# EasyEDA Pro project srm_不晦启明_B.eprj, schematic remote

## Sheets
1 MCU: Board Name: Board2; Create Date: 2026-10-03; Page Name: MCU; Project Name: 不晦启明_srm; Schematic Name: remote; Update Date: 2026-10-06; Company: 嘉立创EDA; Page Size: A4; Version: V1.0
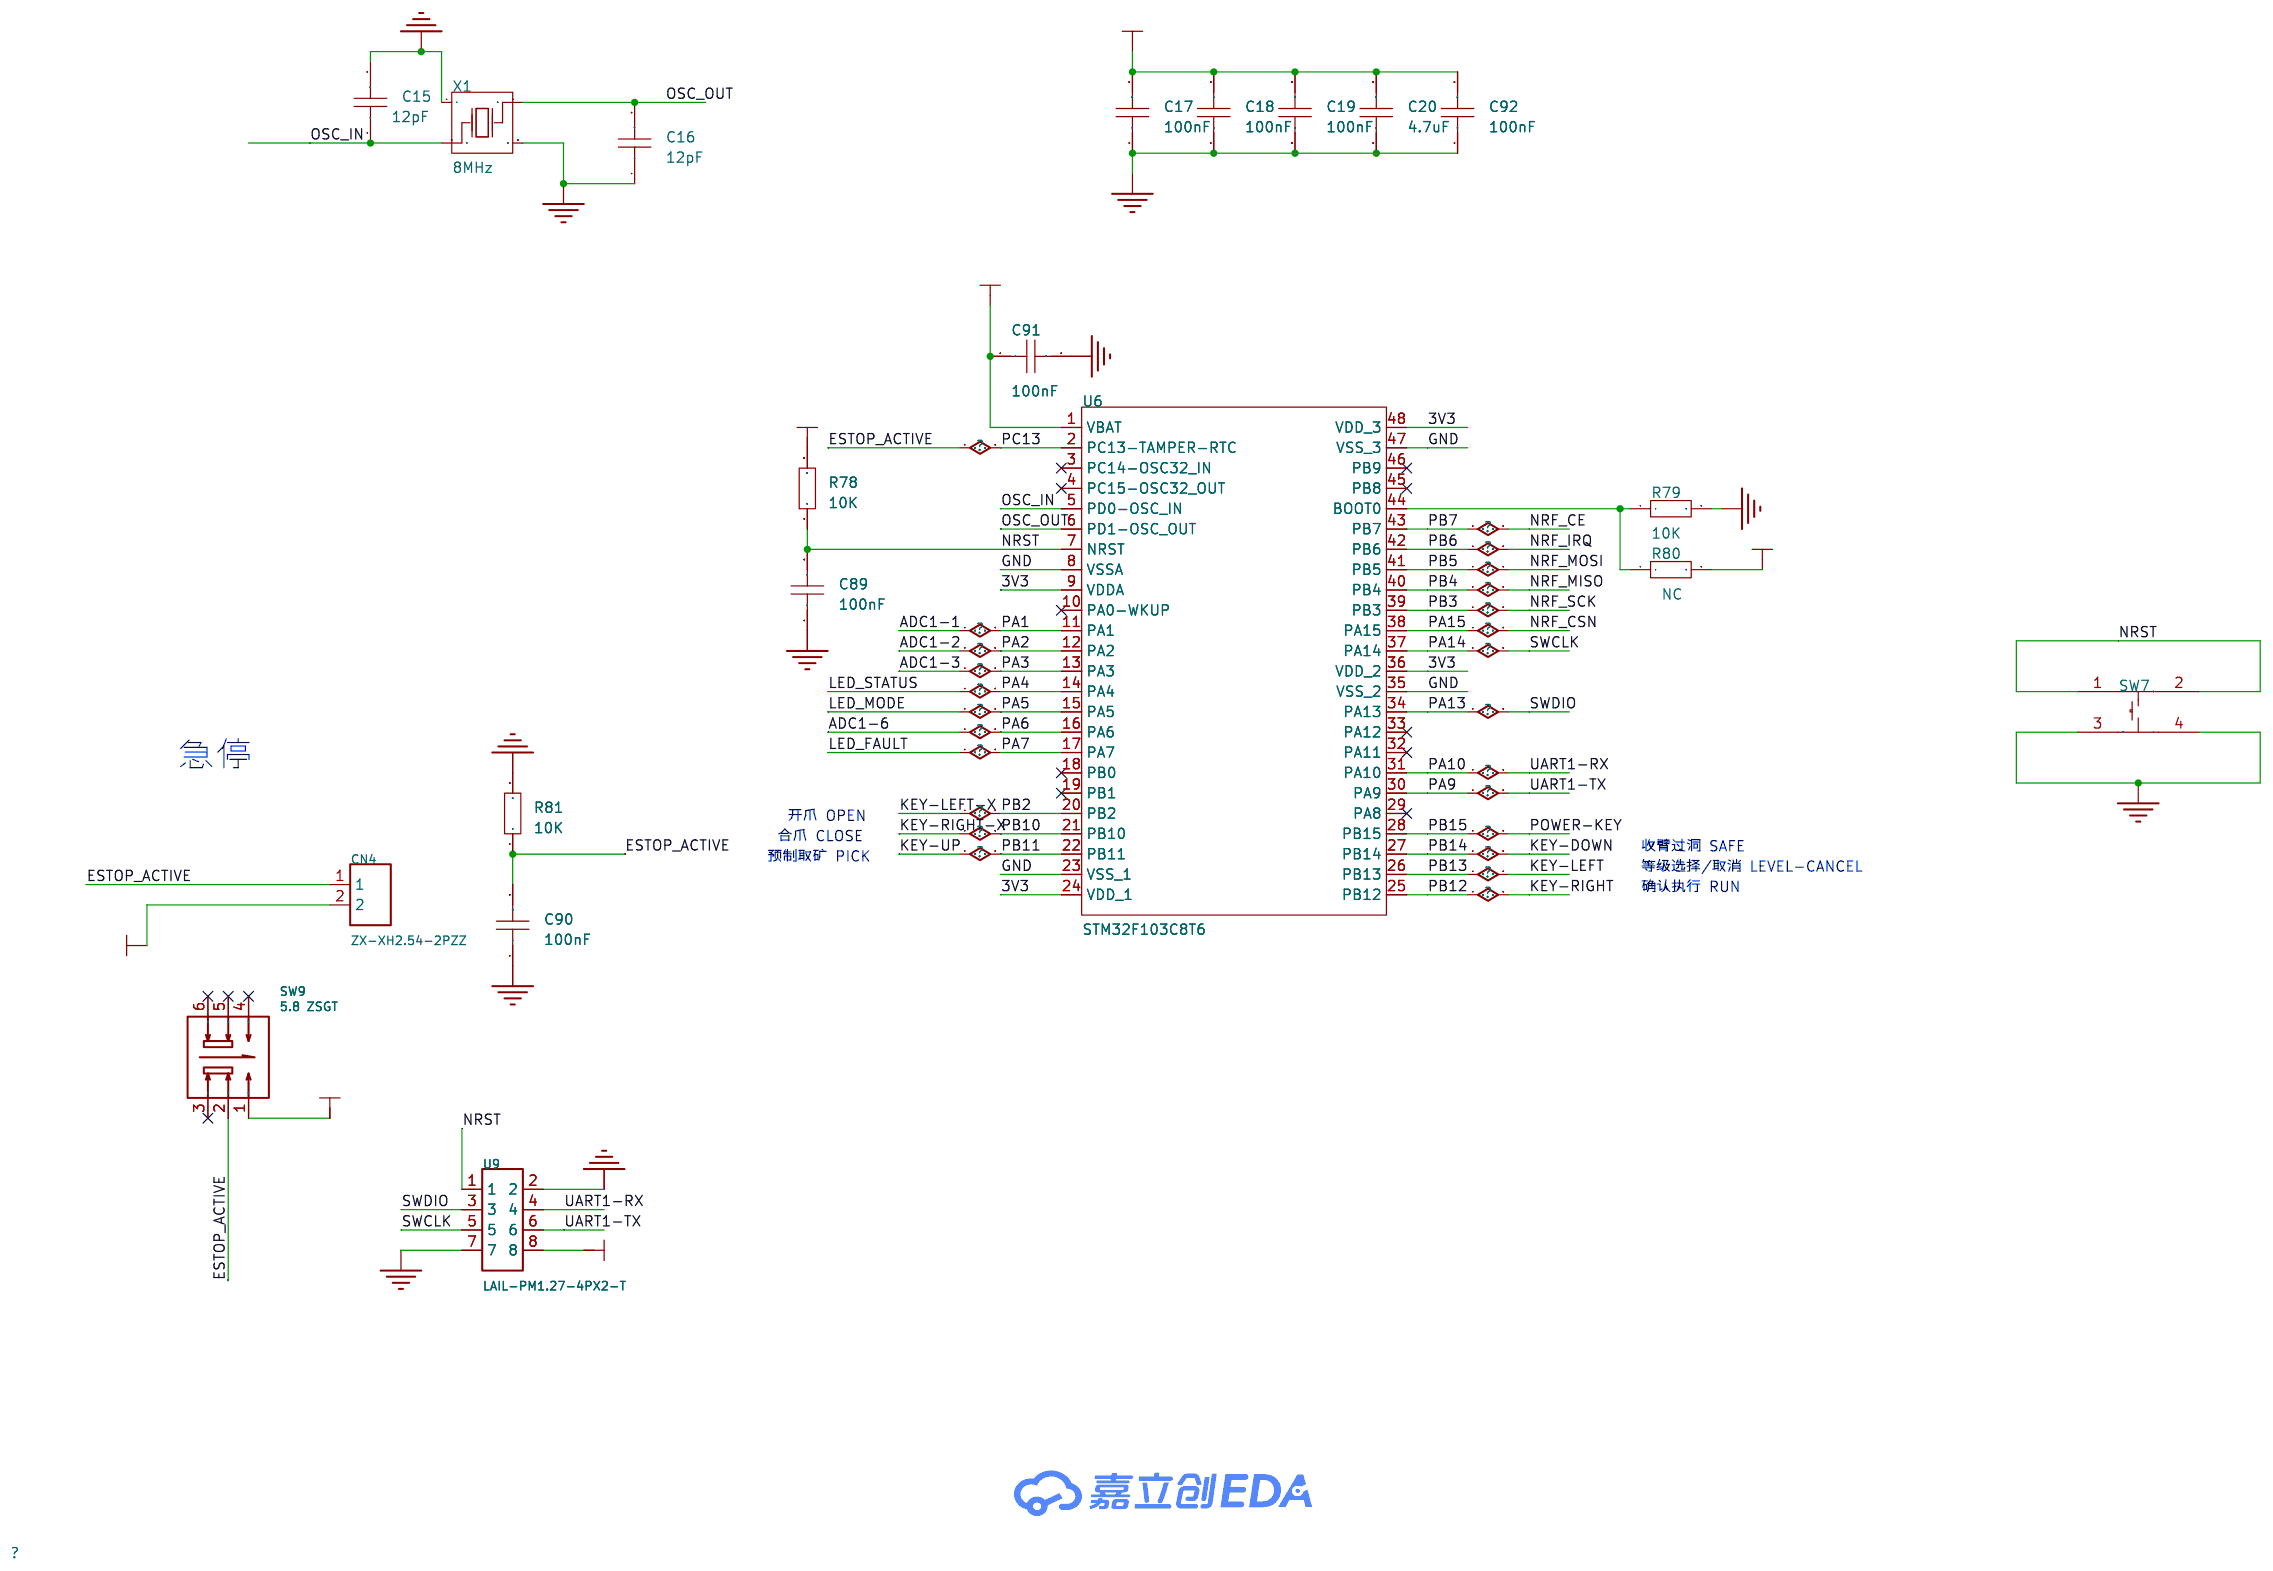
[diagram p8: MCU]
2 无线: Create Date: 2026-10-05; Page Name: 无线; Update Date: 2026-10-05
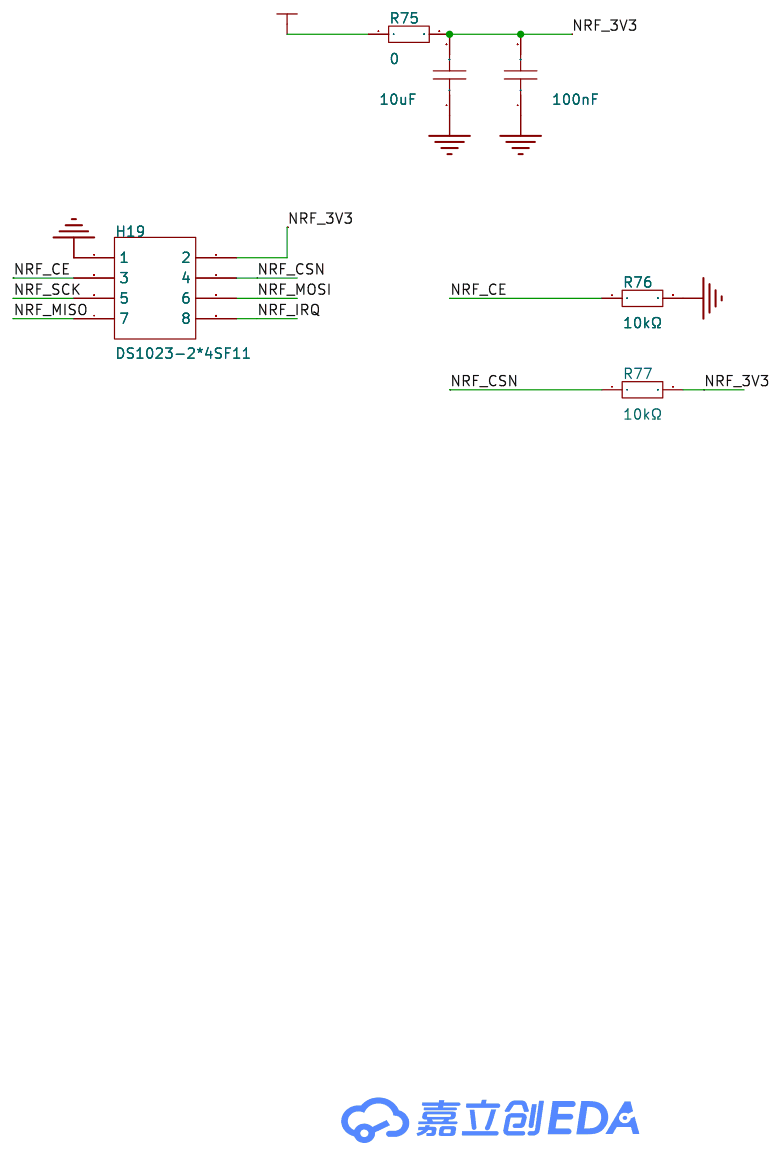
[diagram p9: 无线]
3 遥感和按键: Create Date: 2026-10-05; Page Name: 遥感和按键; Update Date: 2026-10-05
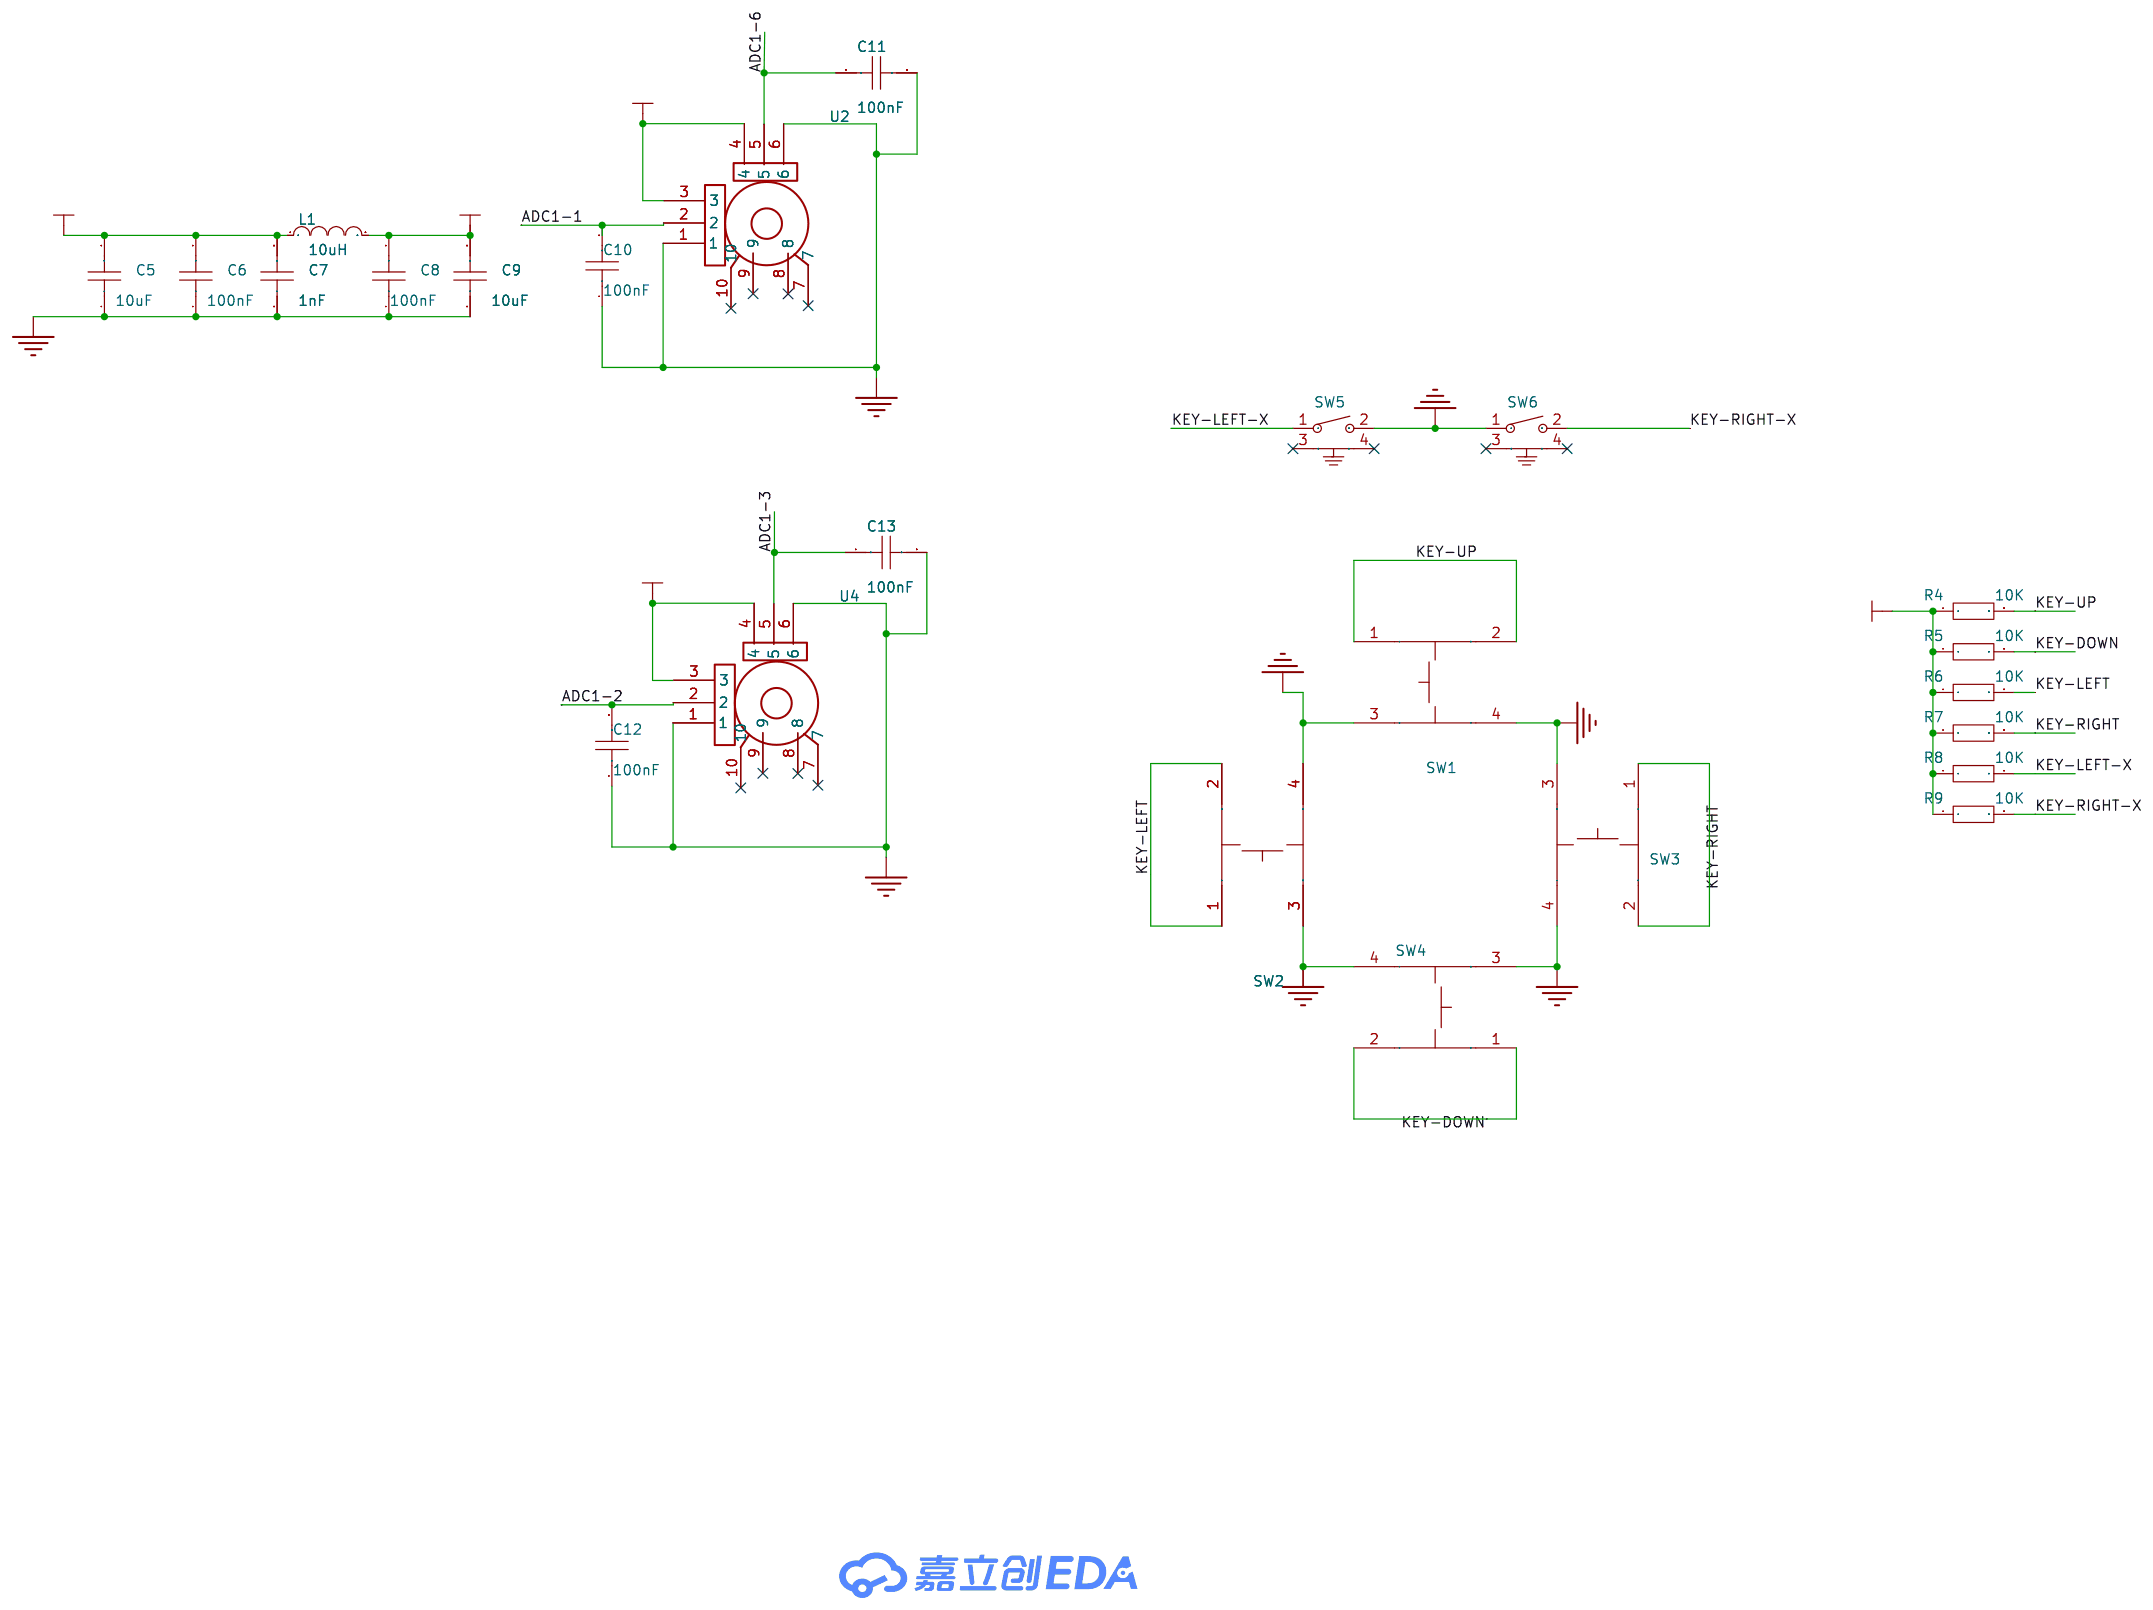
[diagram p10: 遥感和按键]
4 指示灯: Create Date: 2026-10-05; Page Name: 指示灯; Update Date: 2026-10-05
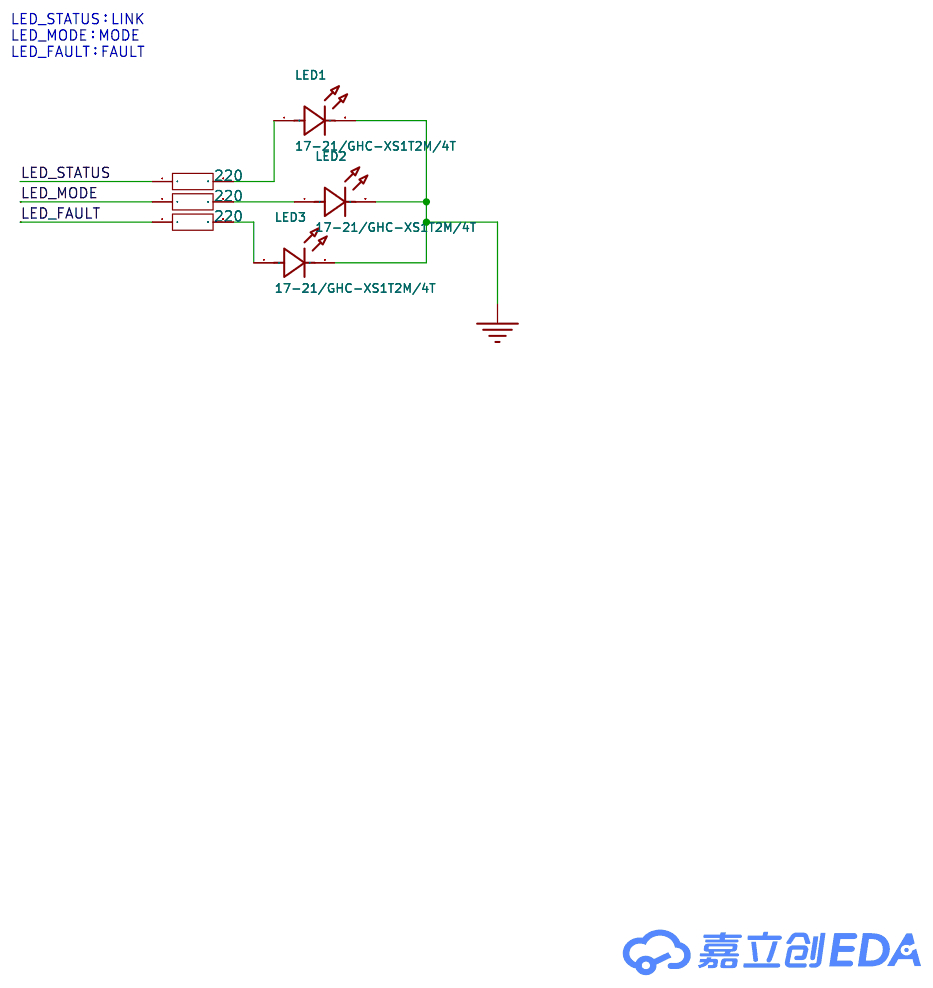
[diagram p11: 指示灯]
5 电源管理: Create Date: 2026-10-05; Page Name: 电源管理; Update Date: 2026-10-05
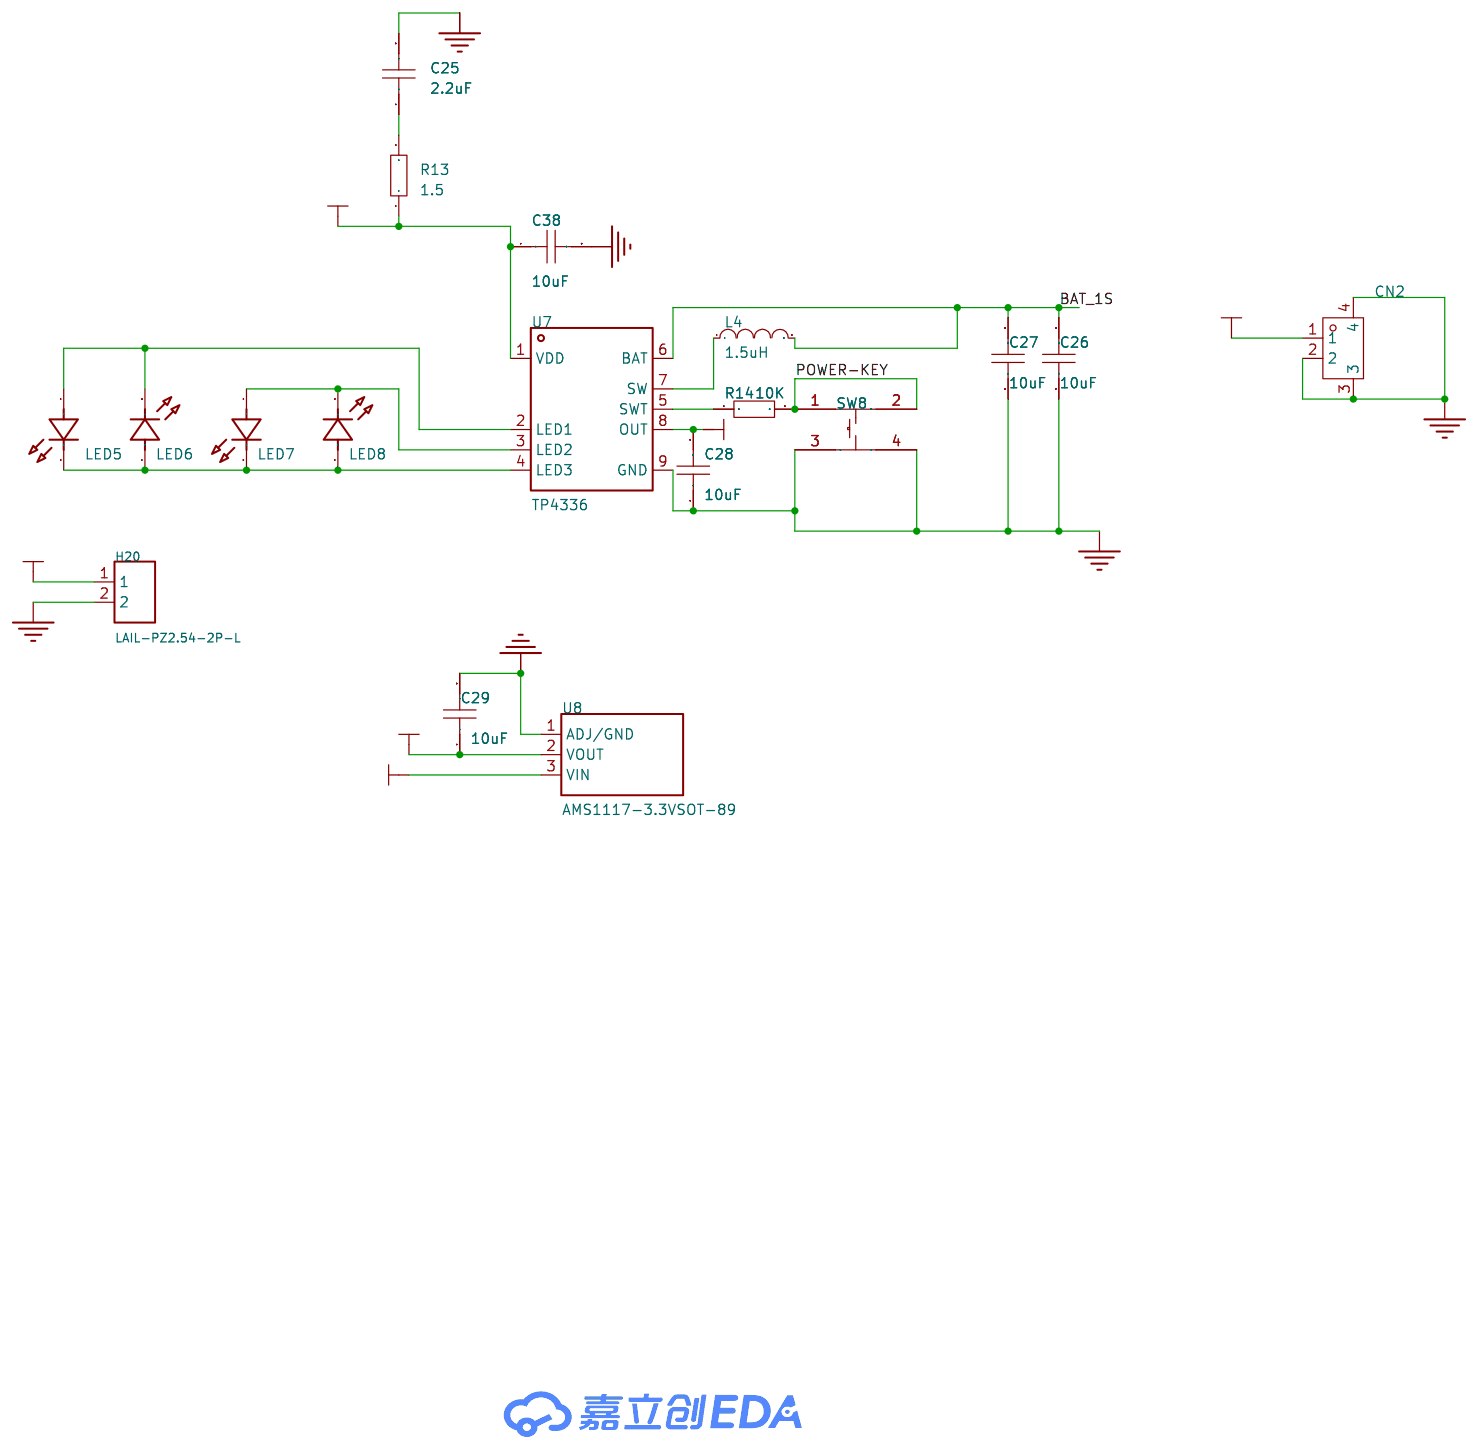
[diagram p12: 电源管理]

## Parts
sheet MCU
C15  12pF  [C0603]
C16  12pF  [C0603]
C17  100nF  [C0603]
C18  100nF  [C0603]
C19  100nF  [C0603]
C20  4.7uF  [C0603]
C89  100nF  [C0603]
C90  100nF  [C0603]
C91  100nF  [C0603]
C92  100nF  [C0603]
CN4  ZX-XH2.54-2PZZ  [CONN-TH_2P-P2.50_HX25003-2A]
R78  10K  [R0603]
R79  10K  [R0603]
R80  NC  [R0603]
R81  10K  [R0603]
SW7  SKRPACE010  [KEY-SMD_4P-L4.2-W3.2-P2.20-LS4.6]
SW9  5.8 ZSGT  [SW-TH_5.8ZSGT]
U6  STM32F103C8T6  [LQFP-48_L7.0-W7.0-P0.50-LS9.0-BL]
U9  LAIL-PM1.27-4PX2-T  [HDR-SMD_8P-P1.27-V-M-R2-C4-LS5.0]
X1  8MHz  [CRYSTAL-SMD_4P-L3.2-W2.5-BL]
sheet 指示灯
LED1  17-21/GHC-XS1T2M/4T  [LED0805-FD-GREEN]
LED2  17-21/GHC-XS1T2M/4T  [LED0805-FD-GREEN]
LED3  17-21/GHC-XS1T2M/4T  [LED0805-FD-GREEN]
R86  220  [R0603]
R87  220  [R0603]
R88  220  [R0603]
sheet 无线
C87  10uF  [C0603]
C88  100nF  [C0603]
H19  DS1023-2*4SF11  [HDR-TH_8P-P2.54-V-F-R2-C4-S2.54]
R75  0  [R0603]
R76  10kΩ  [R0603]
R77  10kΩ  [R0603]
sheet 电源管理
C25  2.2uF  [C0603]
C26  10uF  [C0603]
C27  10uF  [C0603]
C28  10uF  [C0603]
C29  10uF  [C0603]
C38  10uF  [C0603]
CN2  ZX-XH2.54-2PWT  [CONN-SMD_2P-P2.54_MEGASTAR_ZX-XH2.54-2PWT]
H20  LAIL-PZ2.54-2P-L  [CONN-TH_LAIL-PZ2.54-2P-L]
L4  1.5uH  [L0603]
LED5  XL-1005UYC  [LED0402-FD_YELLOW]
LED6  XL-1005UYC  [LED0402-FD_YELLOW]
LED7  XL-1005UYC  [LED0402-FD_YELLOW]
LED8  XL-1005UYC  [LED0402-FD_YELLOW]
R13  1.5  [R0603]
R14  10K  [R0603]
SW8  SKRPACE010  [KEY-SMD_4P-L4.2-W3.2-P2.20-LS4.6]
U7  TP4336  [ESOP-8_L4.9-W3.9-P1.27-LS6.0-BL-EP-1]
U8  AMS1117-3.3VSOT-89  [SOT-89-3_L4.5-W2.5-P1.50-LS4.2-BR]
sheet 遥感和按键
C5  10uF  [C0603]
C6  100nF  [C0603]
C7  1nF  [C0603]
C8  100nF  [C0603]
C9  10uF  [C0603]
C10  100nF  [C0603]
C11  100nF  [C0603]
C12  100nF  [C0603]
C13  100nF  [C0603]
L1  10uH  [L0603]
R4  10K  [R0603]
R5  10K  [R0603]
R6  10K  [R0603]
R7  10K  [R0603]
R8  10K  [R0603]
R9  10K  [R0603]
SW1  TS-1102S-C-M-B  [KEY-SMD_4P-L6.0-W6.0-P4.50-LS8.6_TS-1102S-C-M-B]
SW2  TS-1102S-C-M-B  [KEY-SMD_4P-L6.0-W6.0-P4.50-LS8.6_TS-1102S-C-M-B]
SW3  TS-1102S-C-M-B  [KEY-SMD_4P-L6.0-W6.0-P4.50-LS8.6_TS-1102S-C-M-B]
SW4  TS-1102S-C-M-B  [KEY-SMD_4P-L6.0-W6.0-P4.50-LS8.6_TS-1102S-C-M-B]
SW5  UK-B02124G90-AQ25Y  [SW-TH_UK-B02124G90-AQ25Y]
SW6  UK-B02124G90-AQ25Y  [SW-TH_UK-B02124G90-AQ25Y]
U2  -  [1616]
U4  -  [1616]

## Library data of the parts
C5-C13 C15-C20 C25-C29 C38 C87-C92 = CAP_0603: Supplier Footprint: 0603
CN4 = ZX-XH2.54-2PZZ: 插针结构:1x2P;间距:2.5mm;安装方式:直插;参考系列:XH;总PIN数:2P;排数:1;每排PIN数:2;行距:-;额定电流:2A;触头材质:黄铜;触头镀层:锡;工作温度:-25℃~+85℃;; LCSC Part Name: 1x2P 间距:2.5mm 直插 系列:XH; Supplier Part: C7429632; Manufacturer: Megastar(兆星); Supplier Footprint: 插件,P=2.5mm; JLCPCB Part Class: Extended Part; Datasheet: https://item.szlcsc.com/datasheet/ZX-XH2.54-2PZZ/8427549.html; Supplier: LCSC; Pins Structure: 1x2P; Pitch: 2.5mm; Mounting Type: 直插; Reference Series: XH; Number of Pins: 2P; Number of Rows: 1; Number of PINs Per Row: 2; Current Rating: 2A; Contact Material: 黄铜; Contact Plating: 锡; Operating Temperature: -25℃~+85℃; Voltage Rating: 250V; Plastic Material: PA66; Flame Retardant Rating: UL94V-0; Color: 白色; Z-Height of the Board: 7mm; X-Length of Bottom Edge on Board (Spacing Line): 7.5mm; Y-Width of Bottom Edge on Board: 5.9mm
R4-R9 R13 R14 R75 R78-R81 R86-R88 = Res_0603: Supplier Footprint: 0603
SW7 SW8 = SKRPACE010: LCSC Part Name: 4.2*3.2*2.5mm 立贴 轻触开关; Supplier Part: C139797; Manufacturer: ALPSALPINE(阿尔卑斯阿尔派); Supplier Footprint: SMD-4P,4.2x3.2mm; JLCPCB Part Class: Extended Part; Datasheet: https://item.szlcsc.com/datasheet/SKRPACE010/151122.html; Supplier: LCSC; Circuit: 单刀单掷; Actuator Style: 椭圆形按钮; Mounting Type: 立贴; Length: 4.2mm; Width: 3.2mm; Switch Height: 2.5mm; Contact Current: 50mA; Voltage Rating: 16V
SW9 = 5.8 ZSGT: 电路结构:双刀双掷;自锁/无锁:自锁;安装方式:直插;触点电流:100mA;额定电压:30V;带灯:不带;作用力:1.5N;工作寿命:5千次;; LCSC Part Name: 5.8*5.8/5.8x5.8 180gf 自锁开关; Supplier Part: C2681587; Manufacturer: SHOU HAN(首韩); Supplier Footprint: 插件; JLCPCB Part Class: 扩展库; Datasheet: https://item.szlcsc.com/datasheet/5.8%2520ZSGT/2774930.html; Supplier: LCSC; Circuit: 双刀双掷; Self Lock / No Lock: 自锁; Actuator Style: 方形按钮; Mounting Type: 直插; Contact Current: 100mA; Voltage Rating: 30V; Actuator/Cap Color: 白色; With Lamp: 不带; Termination Style: PC引脚; Operating Force: 1.5N; Operating Temperature: -10℃~+70℃; Life: 5千次
U6 = STM32F103C8T6: LCSC Part Name: 主流增强型ARM Cortex-M3 MCU，具有64 KB Flash、72 MHz CPU、电机控制、USB和CAN; Supplier Part: C8734; Manufacturer: ST(意法半导体); Supplier Footprint: LQFP-48(7x7); JLCPCB Part Class: Extended Part; Datasheet: https://item.szlcsc.com/datasheet/STM32F103C8T6/9243.html; Supplier: LCSC; CPU Core: ARM-M3; CPU Maximum Speed: 72MHz; Program Storage Size: 64KB; Program Memory Type: FLASH; Number of I/O: 37; ADC (Bit): 12bit; Voltage - Supply: 2V~3.6V
U9 = LAIL-PM1.27-4PX2-T: 插孔结构:2x4P;间距:1.27mm;行距:1.27mm;圆孔/方孔:方孔;排数:双排;总孔位数:8P;额定电流:1A;额定电压:250V;插孔方向:顶部;塑高:4.3mm;触头材质:磷铜;触头镀层:金;工作温度:-25℃~+80℃;; LCSC Part Name: 2x4P 间距:1.27mm; Supplier Part: C54973808; Manufacturer: LAILAN(莱联); Supplier Footprint: SMD,P=1.27mm; JLCPCB Part Class: 扩展库; Datasheet: https://item.szlcsc.com/datasheet/LAIL-PM1.27-4PX2-T/58554886.html; Supplier: LCSC; Holes Structure: 2x4P; Pitch: 1.27mm; Row Spacing: 1.27mm; Circular Hole / Square Hole: 方孔; Number of Rows: 双排; Number of Positions: 8P; Current Rating: 1A; Voltage Rating (Max): 250V; Holes Direction: 顶部; Insulation Height: 4.3mm; Contact Material: 磷铜; Contact Plating: 金; Operating Temperature: -25℃~+80℃
X1 = TAXM8M4RDBCCT2T: LCSC Part Name: 8MHz ±10ppm 10pF; Supplier Part: C400090; Manufacturer: YJX(雅晶鑫); Supplier Footprint: SMD3225-4P; JLCPCB Part Class: Extended Part; Datasheet: https://item.szlcsc.com/datasheet/TAXM8M4RDBCCT2T/383475.html; Supplier: LCSC; Type: 贴片晶振; Normal temperature Frequency Tolerance: ±10ppm; Load Capacitance: 10pF; Frequency Stability: ±15ppm; Equivalent Series Resistance(ESR): 250Ω; Operating Temperature: -40℃~+85℃
LED1-LED3 = 17-21/GHC-XS1T2M/4T: 灯头类型:-;发光颜色:绿色;正向压降(Vf):2.75V~3.95V;功率:95mW;正向电流:25mA;波长:520nm~525nm;二极管配置:独立二极管;透镜颜色:无色透明透镜;色温:-;发光强度:180mcd~450mcd;发光角度:140°;载带方式:-;工作温度:-40℃~+85℃;; LCSC Part Name: 绿色 独立二极管; Supplier Part: C2971978; Manufacturer: EVERLIGHT(亿光); Supplier Footprint: 0805; JLCPCB Part Class: 扩展库; Datasheet: https://www.everlighteurope.com/custom/files/datasheets/DSE-0025607.pdf; Supplier: LCSC; Illumination Color: 绿色; Voltage - Forward(Vf): 2.75V~3.95V; Power(Watts): 95mW; Forward Current: 25mA; Wavelength - Dominant: 520nm~525nm; Peak Wavelength: 518nm; Diode Configuration: 独立二极管; Lens Color: 无色透明透镜; Luminous Intensity: 180mcd~450mcd; Viewing Angle: 140°; Operating Temperature: -40℃~+85℃
H19 = DS1023-2*4SF11: 插孔结构:2x4P;间距:2.54mm;行距:2.54mm;安装方式:直插;排数:双排;总孔位数:8P;额定电流:3A;额定电压:600V;插孔方向:顶部;塑高:8.5mm;触头材质:-;触头镀层:金;工作温度:-40℃~+105℃;; LCSC Part Name: 黑色 2x4P 间距:2.54mm 直插; Supplier Part: C92271; Manufacturer: CONNFLY; Supplier Footprint: 插件,P=2.54mm; JLCPCB Part Class: 扩展库; Datasheet: https://item.szlcsc.com/datasheet/DS1023-2*4SF11/93464.html; Supplier: LCSC; Holes Structure: 2x4P; Pitch: 2.54mm; Row Spacing: 2.54mm; Mounting Type: 直插; Number of Rows: 双排; Number of Positions: 8P; Current Rating: 3A; Voltage Rating (Max): 600V; Holes Direction: 顶部; Insulation Height: 8.5mm; Contact Plating: 金; Operating Temperature: -40℃~+105℃
R76 R77 = 0603WAF1002T5E: 电阻类型:厚膜电阻;阻值:10kΩ;精度:±1%;功率:100mW;温度系数:±100ppm/℃;最大工作电压:75V;工作温度范围:-55℃~+155℃;; LCSC Part Name: 10kΩ ±1% 100mW; Supplier Part: C25804; Manufacturer: UNI-ROYAL(厚声); Supplier Footprint: 0603; JLCPCB Part Class: Basic Part; Datasheet: https://atta.szlcsc.com/upload/public/pdf/source/20200306/C422600_1E6D84923E4A46A82E41ADD87F860B5C.pdf; Supplier: LCSC; Type: 厚膜电阻; Tolerance: ±1%; Power(Watts): 100mW; Temperature Coefficient: ±100ppm/℃; Overload Voltage (Max): 75V; Operating Temperature Range: -55℃~+155℃
CN2 = ZX-XH2.54-2PWT: LCSC Part Name: 1x2P 间距:2.5mm 卧贴 系列:XH; Supplier Part: C7429671; Manufacturer: Megastar(兆星); Supplier Footprint: SMD,P=2.5mm,卧贴; JLCPCB Part Class: Extended Part; Datasheet: https://item.szlcsc.com/datasheet/ZX-XH2.54-2PWT/8427588.html; Supplier: LCSC; Pins Structure: 1x2P; Pitch: 2.5mm; Mounting Type: 卧贴; Reference Series: XH; Number of Pins: 2P; Number of Rows: 1; Number of PINs Per Row: 2; Current Rating: 3A; Contact Material: 黄铜; Contact Plating: 锡; Operating Temperature: -25℃~+85℃; Voltage Rating: 250V; Plastic Material: LCP; Supplementary Features: 辅助焊脚; Color: 米色; Z-Height of the Board: 6.2mm; X-Length of Bottom Edge on Board (Spacing Line): 10mm; Y-Width of Bottom Edge on Board: 7.8mm
H20 = LAIL-PZ2.54-2P-L: 插针结构:1x2P;间距:2.54mm;圆针/方针:方针;安装方式:直插;排数:单排;总PIN位数:2P;额定电流:3A;额定电压:250V;配合针长度:6mm;塑高:2.5mm;端接针长度:3mm;触头材质:黄铜;触头镀层:金;工作温度:-25℃~+80℃;颜色:黑色;; LCSC Part Name: 1x2P 间距:2.54mm 方针 直插; Supplier Part: C54950603; Manufacturer: LAILAN(莱联); Supplier Footprint: 插件,P=2.54mm; JLCPCB Part Class: 扩展库; Datasheet: https://item.szlcsc.com/datasheet/LAIL-PZ2.54-2P-L/58519956.html; Supplier: LCSC; Pin Structure: 1x2P; Pitch: 2.54mm; Circluar Pins/Square Pins: 方针; Mounting Type: 直插; Number of Rows: 单排; Number of Pins: 2P; Current Rating: 3A; Voltage Rating (Max): 250V; Length of Mating Pin: 6mm; Insulation Height: 2.5mm; Length of End Connection Pin: 3mm; Contact Material: 黄铜; Contact Plating: 金; Operating Temperature: -25℃~+80℃; Color: 黑色
L1 L4 = L_0603
LED5-LED8 = XL-1005UYC_C25503856: LCSC Part Name: 0402黄光贴片式发光二极管; Supplier Part: C25503856; Manufacturer: XINGLIGHT(成兴光); Supplier Footprint: 0402; JLCPCB Part Class: Extended Part; Datasheet: https://item.szlcsc.com/datasheet/XL-1005UYC/27234970.html; Supplier: LCSC; Lamp Holder Type: 1.0mmx0.5mm方形灯头; Illumination Color: 黄色; Voltage - Forward(Vf): 2.4V; Power(Watts): 50mW; Forward Current: 20mA; Wavelength - Dominant: 585nm~595nm; Peak Wavelength: 590nm; Diode Configuration: 独立二极管; Lens Color: 无色透明透镜; Luminous Intensity: 210mcd; Viewing Angle: 120°; Operating Temperature: -40℃~+85℃
U7 = TP4336: LCSC Part Name: 单通道1-Wire主控制器; Supplier Part: C29075510; Manufacturer: TPOWER(天源); Supplier Footprint: ESOP-8L; JLCPCB Part Class: Extended Part; Datasheet: https://item.szlcsc.com/datasheet/TP4336/30801980.html; Supplier: LCSC
U8 = AMS1117-3.3VSOT-89: Supplier Part: C9900008082; Supplier Footprint: SOT-89-3; JLCPCB Part Class: Extended Part; Supplier: LCSC
SW1-SW4 = TS-1102S-C-M-B: 电路结构:单刀单掷;按钮形状:圆形按钮;作用力:2.6N;安装方式:立贴;开关长度:6mm;开关宽度:6mm;开关高度:10mm;带支架:不带支架;触点电流:50mA;额定电压:12V;带灯:无;工作寿命:30万次;; LCSC Part Name: 6*6*10mm 立贴 轻触开关; Supplier Part: C381050; Manufacturer: XKB Connection(中国星坤); Supplier Footprint: SMD-4P,6x6mm; JLCPCB Part Class: 扩展库; Datasheet: https://item.szlcsc.com/datasheet/TS-1102S-C-M-B/353282.html; Supplier: LCSC; Circuit: 单刀单掷; Actuator Style: 圆形按钮; Operating Force: 2.6N; Mounting Type: 立贴; Length: 6mm; Width: 6mm; Switch Height: 10mm; with Bracket: 不带支架; Contact Current: 50mA; Voltage Rating: 12V; Actuator/Cap Color: 黑色; With Lamp: 无; Life: 30万次; Operating Temperature: -20℃~+70℃
SW5 SW6 = UK-B02124G90-AQ25Y: 电路结构:单刀单掷;按钮形状:圆形按钮;作用力:2.5N;安装方式:弯插;开关长度:6mm;开关宽度:6mm;开关高度:9mm;带支架:带支架;触点电流:50mA;额定电压:12V;带灯:无;工作寿命:10万次;; LCSC Part Name: 6*6*9mm 卧插 轻触开关; Supplier Part: C493238; Manufacturer: USAKRO(美韩); Supplier Footprint: 弯插,6x6mm; JLCPCB Part Class: 扩展库; Datasheet: https://item.szlcsc.com/datasheet/UK-B02124G90-AQ25Y/503894.html; Supplier: LCSC; Circuit: 单刀单掷; Actuator Style: 圆形按钮; Operating Force: 2.5N; Mounting Type: 弯插; Length: 6mm; Width: 6mm; Switch Height: 9mm; with Bracket: 带支架; Contact Current: 50mA; Voltage Rating: 12V; Actuator/Cap Color: 黑色; With Lamp: 无; Termination Style: PC引脚; Life: 10万次; Operating Temperature: -20℃~+70℃
U2 U4 = 双路遥感

## Nets
3V3: C8.2 C9.2 C17.2 C18.2 C19.2 C20.2 C29.1 C91.1 C92.2 CN4.2 L1.2 R4.1 R5.1 R6.1 R7.1 R8.1 R9.1 R75.1 R78.2 R80.2 SW9.1 U6.1(VBAT) U6.9(VDDA) U6.24(VDD_1) U6.36(VDD_2) U6.48(VDD_3) U8.2(VOUT) U9.8
3V3A: C5.2 C6.2 C7.2 L1.1 U2.3 U2.4 U4.3 U4.4
5V_SYS: C28.2 U7.8(OUT) U8.3(VIN)
GND: C5.1 C6.1 C7.1 C8.1 C9.1 C10.1 C11.2 C12.1 C13.2 C15.2 C16.1 C17.1 C18.1 C19.1 C20.1 C25.2 C26.1 C27.1 C28.1 C29.2 C38.2 C87.1 C88.1 C89.1 C90.1 C91.2 C92.1 CN2.2 CN2.3 CN2.4 H19.1 H20.2 LED1.2(K) LED2.2(K) LED3.2(K) R76.2 R79.2 R81.2 SW1.3 SW1.4 SW2.3 SW2.4 SW3.3 SW3.4 SW4.3 SW4.4 SW5.2 SW6.1 SW7.3 SW7.4 SW8.3 SW8.4 U2.1 U2.6 U4.1 U4.6 U6.8(VSSA) U6.23(VSS_1) U6.35(VSS_2) U6.47(VSS_3) U7.9(GND) U8.1(ADJ/GND) U9.2 U9.7 X1.2 X1.4
ADC1-1: C10.2 U2.2 U6.11(PA1)
ADC1-2: C12.2 U4.2 U6.12(PA2)
ADC1-3: C13.1 U4.5 U6.13(PA3)
ADC1-6: C11.1 U2.5 U6.16(PA6)
BAT_1S: C26.2 C27.2 CN2.1 L4.2 U7.6(BAT)
ESTOP_ACTIVE: C90.2 CN4.1 R81.1 SW9.2 U6.2(PC13-TAMPER-RTC)
KEY-DOWN: R5.2 SW4.1 SW4.2 U6.27(PB14)
KEY-LEFT: R6.2 SW2.1 SW2.2 U6.26(PB13)
KEY-LEFT-X: R8.2 SW5.1 U6.20(PB2)
KEY-RIGHT: R7.2 SW3.1 SW3.2 U6.25(PB12)
KEY-RIGHT-X: R9.2 SW6.2 U6.21(PB10)
KEY-UP: R4.2 SW1.1 SW1.2 U6.22(PB11)
LED_FAULT: R88.1 U6.17(PA7)
LED_MODE: R87.1 U6.15(PA5)
LED_STATUS: R86.1 U6.14(PA4)
NRF_3V3: C87.2 C88.2 H19.2 R75.2 R77.2
NRF_CE: H19.3 R76.1 U6.43(PB7)
NRF_CSN: H19.4 R77.1 U6.38(PA15)
NRF_IRQ: H19.8 U6.42(PB6)
NRF_MISO: H19.7 U6.40(PB4)
NRF_MOSI: H19.6 U6.41(PB5)
NRF_SCK: H19.5 U6.39(PB3)
NRST: C89.2 R78.1 SW7.1 SW7.2 U6.7(NRST) U9.1
OSC_IN: C15.1 U6.5(PD0-OSC_IN) X1.1
OSC_OUT: C16.2 U6.6(PD1-OSC_OUT) X1.3
PA9: U6.30(PA9) U9.6
PA10: U6.31(PA10) U9.4
PA13: U6.34(PA13) U9.3
PA14: U6.37(PA14) U9.5
PB15: R14.2 SW8.1 SW8.2 U6.28(PB15)
USB_5V: C38.1 H20.1 R13.1 U7.1(VDD)
Net-(C25-1): C25.1 R13.2
Net-(L4-1): L4.1 U7.7(SW)
Net-(LED1-1): LED1.1(A) R86.2
Net-(LED2-1): LED2.1(A) R87.2
Net-(LED3-1): LED3.1(A) R88.2
Net-(LED5-1): LED5.1(A) LED6.2(K) U7.2(LED1)
Net-(LED5-2): LED5.2(K) LED6.1(A) LED7.2(K) LED8.1(A) U7.4(LED3)
Net-(LED7-1): LED7.1(A) LED8.2(K) U7.3(LED2)
Net-(R14-1): R14.1 U7.5(SWT)
Net-(R79-1): R79.1 R80.1 U6.44(BOOT0)

Not connected (* = marked no-connect by the designer): SW5 3(EP)* 4(EP)*; SW6 3(EP)* 4(EP)*; SW9 3* 4* 5* 6*; U2 7* 8* 9* 10*; U4 7* 8* 9* 10*; U6 3(PC14-OSC32_IN)* 4(PC15-OSC32_OUT)* 10(PA0-WKUP)* 18(PB0)* 19(PB1)* 29(PA8)* 32(PA11)* 33(PA12)* 45(PB8)* 46(PB9)*

## Notes on the sheets
sheet 1
- 急停
- 开爪 OPEN
- 合爪 CLOSE
- 收臂过洞 SAFE
- 预制取矿 PICK
- 等级选择/取消 LEVEL-CANCEL
- 确认执行 RUN
sheet 4
- LED_STATUS：LINK
  LED_MODE：MODE
  LED_FAULT：FAULT
